# Altium schematic sheet 204_DC-DC.SchDoc: DC-DC
size A4; Date: XXXXXX; Author: R.Ducuara; DrawnBy: J.Jaramillo; Revision: R1V0; SheetNumber: 7; SheetTotal: 7
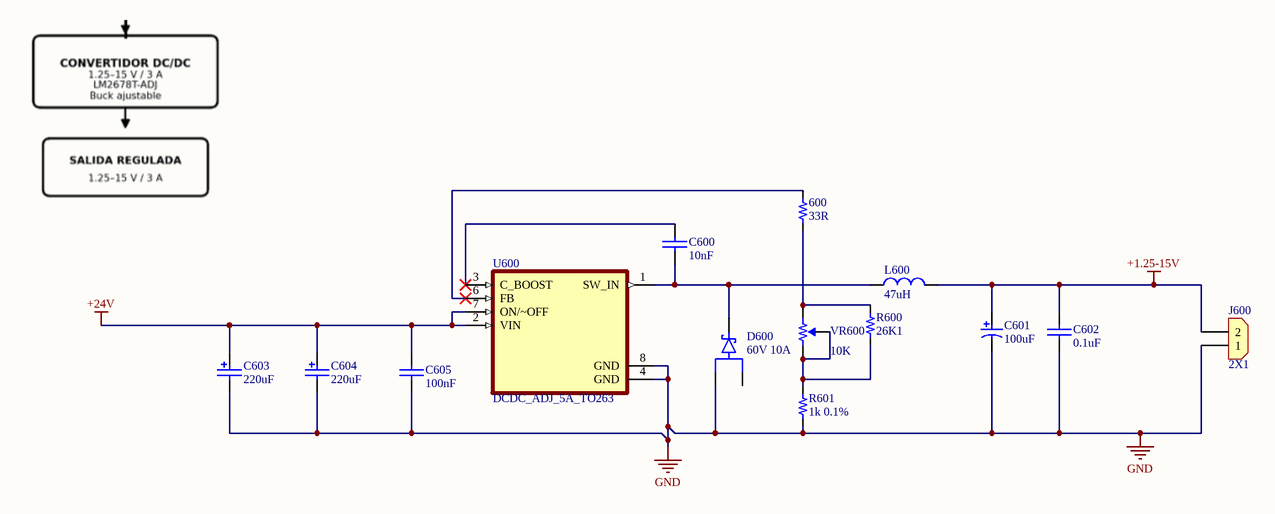
[diagram p0: 204_DC-DC.SchDoc]

## Parts
600  value 33R  [2512]  (hidden comment: 33R 2W)
C600  value 10nF  [0402]  (hidden comment: 10nF 50V)
C601  value 100uF  [RADIAL-CAN-SMD_Diax8mm_Hx10.2mm]  (hidden comment: 100uF 25V)
C602  value 0.1uF  [0603]  (hidden comment: 100nF 25V)
C603  value 220uF  [RADIAL-CAN-SMD_Diax8mm_Hx10.2mm]  (hidden comment: 220uF 50V)
C604  value 220uF  [RADIAL-CAN-SMD_Diax8mm_Hx10.2mm]  (hidden comment: 220uF 50V)
C605  value 100nF  [1206]  (hidden comment: 100nF 100V)
D600  60V 10A  [D_Schottky_30V_200mA_SOT23-3_1]
J600  2X1  [CON_2X1_TH_5MM_BAT]
L600  value 47uH  [L_2SMD_11.5x10X4MM]  (hidden comment: 47uH 3A)
R600  value 26K1  [0603]  (hidden comment: 1/10W)
R601  value 1k 0.1%  [0603]  (hidden comment: 1k 1/10W)
U600  DCDC_ADJ_5A_TO263  [DCDC_ADJ_5A_TO263]
VR600  value 10K  [Pot_3x1_5mm_TH]  (hidden comment: 10k 1/5W)

## Nets
+1.25-15V: C601.1 C602.1 J600.2 L600.2
+24V: C603.1 C604.1 C605.1 U600.2(VIN) U600.7(ON/~OFF)
GND: C601.2 C602.2 C603.2 C604.2 C605.2 D600.1(A1) J600.1 R601.1 U600.4(GND) U600.8(GND)
Net600_1: 600.1 U600.6(FB)
Net600_2: 600.2 R600.1 VR600.1
NetC600_1: C600.1 U600.3(C_BOOST)
NetC600_2: C600.2 D600.3(K) L600.1 U600.1(SW_IN)
NetR600_2: R600.2 R601.2 VR600.2 VR600.3

Not connected (* = marked no-connect by the designer): D600 2(A2)

## Notes on the sheet
- Title:
- Project:
- File:
- Revision:
- Date:
- Size:
- A4
- Drawn by:

## Library data of the parts
600 = Res_33R_2512_2W: RES SMD 33 OHM 1% 2W 2512; Manufacturer Part Number: CRM2512-FX-33R0ELF; Manufacturer: Bourns Inc.; Reel Stock: N/A; Last modified by: J.Jaramillo; Last modified date: 20240310; ComponentLink1Description: Digi-Key; ComponentLink1URL: https://www.digikey.com/product-detail/en/bourns-inc/CRM2512-FX-33R0ELF/CRM2512-FX-33R0ELFCT-ND/5775020; Supplier 1: Digi-Key; Supplier Part Number 1: CRM2512-FX-33R0ELFCT-ND
C600 = Cap_10000pF_0402_50V: CAP CER 10000PF 50V X7R 0402; Manufacturer: Murata Electronics North America; Manufacturer Part Number: GCM155R71H103KA55D; Supplier 1: Digi-Key; Supplier Part Number 1: 490-4762-1-ND; Reel stock: N/A; Last modified by: J.Jaramillo; Last modified date: 20240309; ComponentLink1Description: Digi-Key; ComponentLink1URL: https://www.digikey.com/product-detail/en/murata-electronics-north-america/GCM155R71H103KA55D/490-4762-1-ND/1641681
C601 = Cap_100uF_25V_ALU_SMD: CAP ALUM 100UF 20% 25V SMD; Manufacturer: Panasonic Electronic Components; Manufacturer Part Number: EEE-1EA101AP; Supplier 1: Digi-Key; Supplier Part Number 1: PCE4593CT-ND; Last modified by: J.Jaramillo; Last modified date: 20240309; ComponentLink1Description: Digi-Key; ComponentLink1URL: https://www.digikey.com/product-detail/en/panasonic-electronic-components/EEE-1EA101AP/PCE4593CT-ND/1718016
C602 = Cap_0.1uF_0603_25V: CAP CER 0.1UF 25V X7R 0603; Manufacturer: TDK; Manufacturer Part Number: CGA3E2X7R1E104K080AA; Last modified by: J.Jaramillo; Last modified date: 20240309; ComponentLink1Description: Digi-key; ComponentLink1URL: https://www.digikey.com/en/products/detail/tdk-corporation/CGA3E2X7R1E104K080AA/2443145?s=N4IgTCBcDaIMIHECCBmAomAGgdgEoEY18AGAFgGliAOYpJEAXQF8g; Supplier 1: Digi-Key; Supplier Part Number 1: 445-5667-1-ND
C603 C604 = Cap_220uF_50V_ALU_SMD: CAP ALUM 220UF 20% 50V SMD; Manufacturer: Panasonic; Manufacturer Part Number: EEE-FT1H221AP; Supplier 1: Mouser; Supplier Part Number 1: 667-EEE-FT1H221AP; Reel stock: N/A; Last modified by: J.Jaramillo; Last modified date: 20240309; ComponentLink1Description: Mouser; ComponentLink1URL: https://www.mouser.com/ProductDetail/Panasonic/EEE-FT1H221AP?qs=CMJjuEs1%252BuFFGBuxQbDfDA==
C605 = Cap_0.1uF_1206_100V: CAP CER 0.1UF 100V X7R 1206; Manufacturer: Samsung Electro-Mechanics; Manufacturer Part Number: CL31B104KCFNNNE; Supplier 1: Digi-Key; Supplier Part Number 1: 1276-1151-1-ND; Last modified by: J.Jaramillo; Last modified date: 20240309; ComponentLink1Description: Digi-Key; ComponentLink1URL: https://www.digikey.com/en/products/detail/samsung-electro-mechanics/CL31B104KCFNNNE/3886809
D600 = D_Schottky_60V_10A_ThinDPAK: DIODE SCHOTTKY 60V 10A THINDPAK; Manufacturer: Taiwan Semiconductor Corporation; Manufacturer Part Number: MBRAD1060H; Supplier 1: Digi-Key; Supplier Part Number 1: 1801-MBRAD1060HCT-ND; Reel Stock: N/A; Last modified by: R.Ducuara; Last modified date: 20261120; ComponentLink1Description: Digi-Key; ComponentLink1URL: https://www.digikey.com/en/products/detail/onsemi/SBAT54SLT1G/3062594
J600 = Con_2x1_TH_5mm_Battery: Power Connectors ROHS; Manufacturer: Changzhou Amass Elec; Manufacturer Part Number: XT30U-M; Supplier 1: LCSC; Supplier Part Number 1: C99101; Reel Stock: N/A; Last modified by: J.Jaramillo; Last modified date: 20240310; ComponentLink1Description: Digi-Key; ComponentLink1URL: https://lcsc.com/product-detail/Power-Connectors_Changzhou-Amass-Elec-XT30U-M_C99101.html
L600 = L_47uH_3A_SMD_11.5x10MM: 3A 47uH 4,5A 155mÎ© Â±20% SMD,11,5x10mm Fixed Inductors RoHS; Manufacturer: Shun Xiang Nuo; Manufacturer Part Number: SMMS1040-470M; Supplier 1: LCSC; Supplier Part Number 1: C149599; Reel Stock: N/A; Last modified by: J.Jaramillo; Last modified date: 270326; ComponentLink1Description: Datasheet; ComponentLink1URL: https://www.lcsc.com/datasheet/C149599.pdf; ComponentLink2Description: LCSC; ComponentLink2URL: https://www.lcsc.com/product-detail/C149599.html
R600 = Res_26k1_0603_1/10W: RES SMD 26.1K OHM 1% 1/10W 0603; Manufacturer: Yageo; Manufacturer Part Number: AC0603FR-0726K1L; Reel Stock: N/A; Last modified by: J.Jaramillo; Last modified date: 20240310; ComponentLink1Description: Digi-Key; ComponentLink1URL: https://www.digikey.com/en/products/detail/yageo/AC0603FR-0726K1L/5895956; Supplier 1: Digi-Key; Supplier Part Number 1: 13-AC0603FR-0726K1LCT-ND
R601 = Res_1k_0603_1/10W_0.1%: RES SMD 1K OHM 0.1% 1/10W 0603; Manufacturer: Panasonic Electronic Components; Manufacturer Part Number: ERA-3AEB102V; Supplier 1: Digi-Key; Supplier Part Number 1: P1.0KDBCT-ND; Reel Stock: N/A; Last modified by: J.Jaramillo; Last modified date: 20240310; ComponentLink1Description: Digi-Key; ComponentLink1URL: https://www.digikey.com/en/products/detail/panasonic-electronic-components/ERA-3AEB102V/1465854
U600 = DCDC_ADJ_5A_TO263: IC REG BUCK ADJ 5A TO263; Manufacturer: Texas Instruments; Manufacturer Part Number: LM2678S-ADJ; Supplier 1: Digikey; Supplier Part Number 1: LM2678S-ADJ-ND; Reel Stock: N/A; Last modified by: R.Ducuara; Last modified date: 20261120
VR600 = Pot_10k_1/5W_TH: POT 10K OHM 1/5W PLASTIC LINEAR; Manufacturer: TT Electronics/BI; Manufacturer Part Number: P160KN-0QC15B10K; Reel Stock: N/A; Last modified by: J.Jaramillo; Last modified date: 20240310; ComponentLink1Description: Digi-key; ComponentLink1URL: https://www.digikey.com/products/en?keywords=P160KN-0QC15B10K; Supplier 1: Digi-Key; Supplier Part Number 1: 987-1301-ND